# EAGLE design source_eagle (EAGLE 6.4)
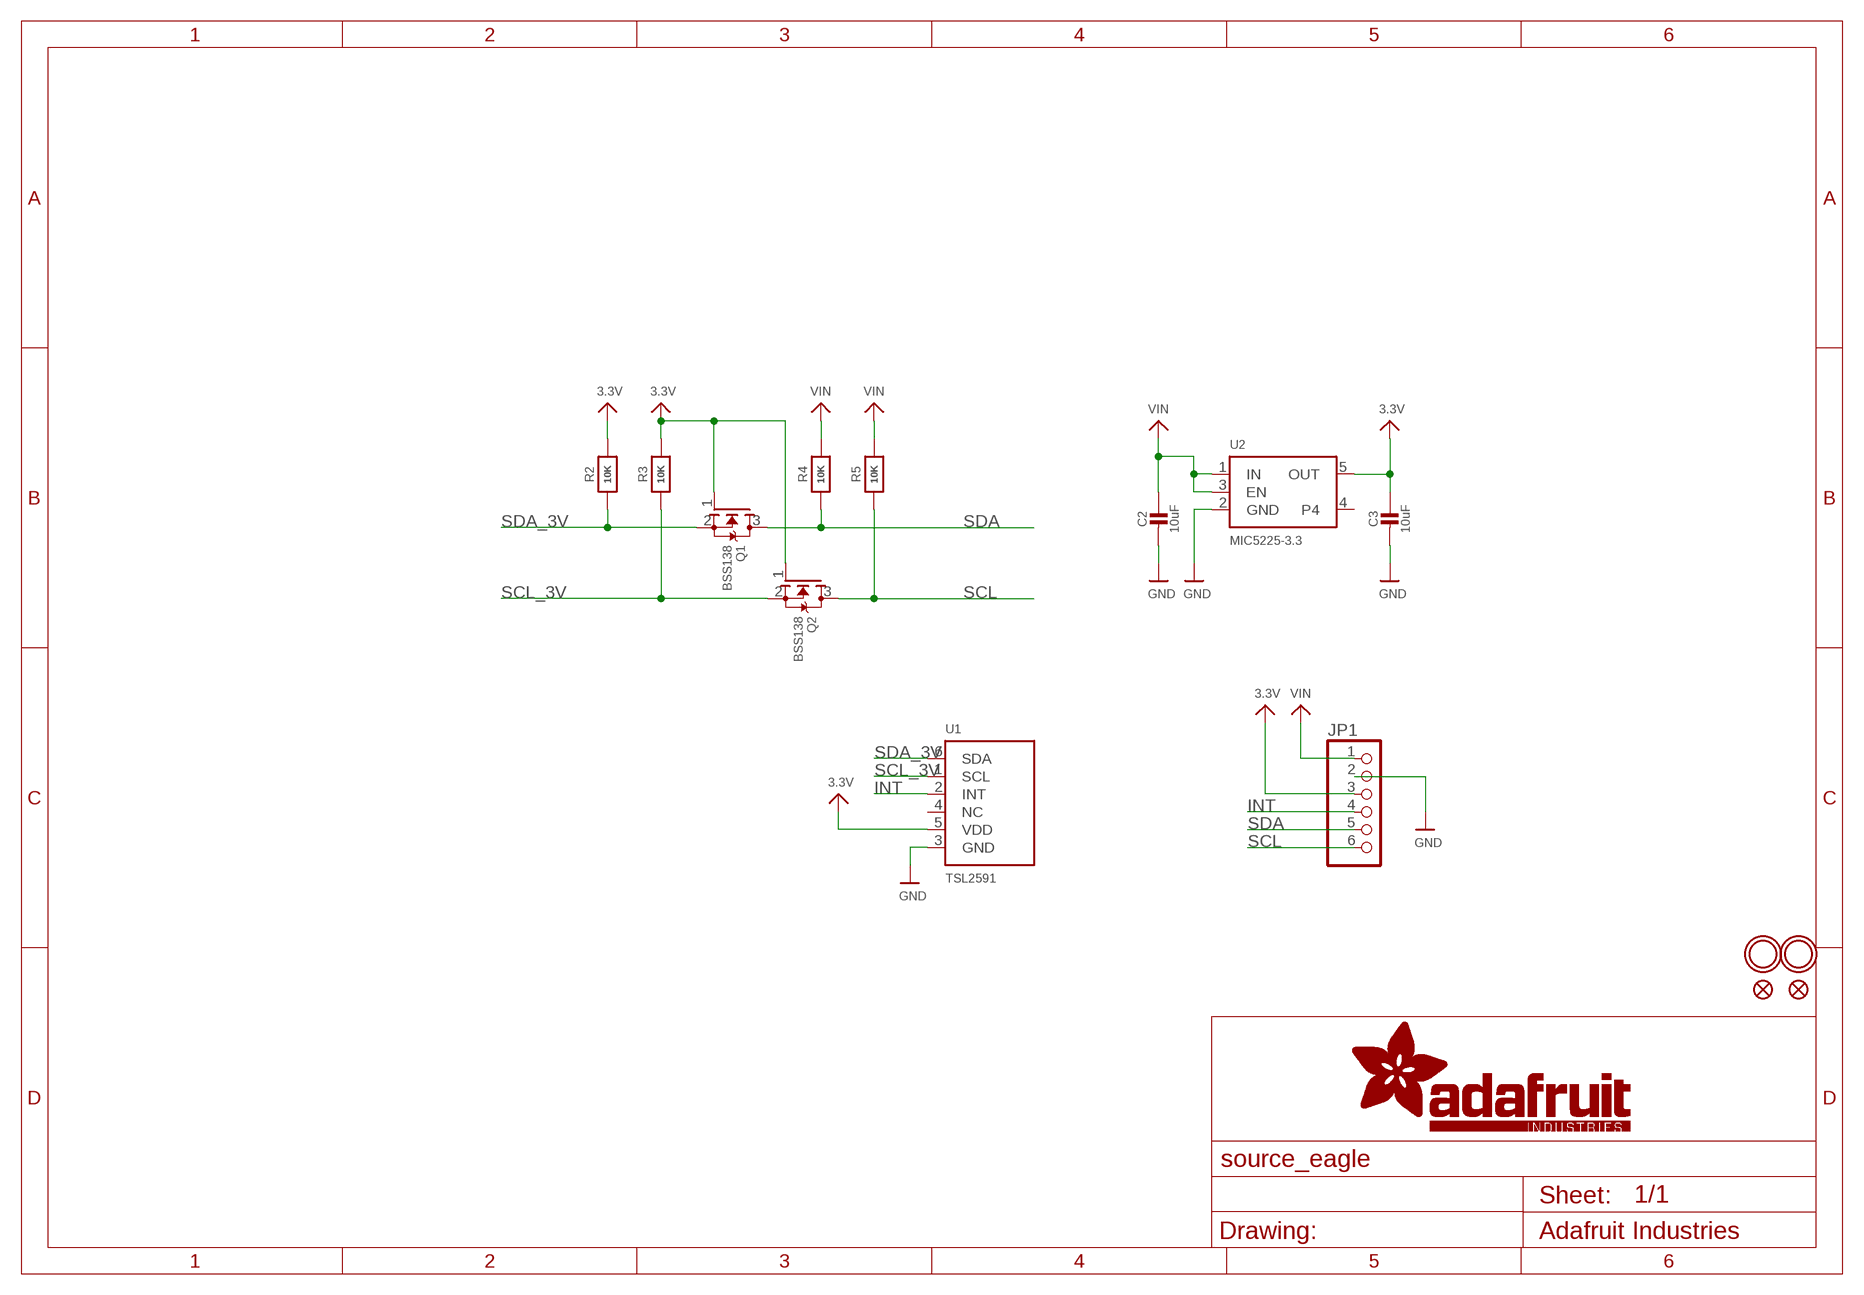
[diagram p0: schematic, sheet 1]

## Parts
C2  10uF  CAP_CERAMIC0805-NOOUTLINE  [0805-NO]
C3  10uF  CAP_CERAMIC0805-NOOUTLINE  [0805-NO]
FID1  FIDUCIAL""  [FIDUCIAL_1MM]
FID2  FIDUCIAL""  [FIDUCIAL_1MM]
JP1  HEADER-1X676MIL_FULLROUND  [1X06_ROUND_FULL_76]
Q1  BSS138  MOSFET-NWIDE  [SOT23-WIDE]
Q2  BSS138  MOSFET-NWIDE  [SOT23-WIDE]
R2  10K  RESISTOR0805_NOOUTLINE  [0805-NO]
R3  10K  RESISTOR0805_NOOUTLINE  [0805-NO]
R4  10K  RESISTOR0805_NOOUTLINE  [0805-NO]
R5  10K  RESISTOR_0805MP  [_0805MP]
U1  TSL2591  LIGHT_TSL2591  [DFN6_TAOS]
U2  MIC5225-3.3  VREG_SOT23-5  [SOT23-5]
U$18  MOUNTINGHOLE2.5  [MOUNTINGHOLE_2.5_PLATED]
U$19  MOUNTINGHOLE2.5  [MOUNTINGHOLE_2.5_PLATED]

## Nets
3.3V: C3.1 JP1.3 Q1.1(G) Q2.1(G) R2.2 R3.2 U1.5(VDD) U2.5(OUT)
GND: C2.2 C3.2 JP1.2 U1.3(GND) U2.2(GND)
INT: JP1.4 U1.2(INT)
SCL: JP1.6 Q2.3(D) R5.1
SCL_3V: Q2.2(S) R3.1 U1.1(SCL)
SDA: JP1.5 Q1.3(D) R4.1
SDA_3V: Q1.2(S) R2.1 U1.6(SDA)
VIN: C2.1 JP1.1 R4.2 R5.2 U2.1(IN) U2.3(EN)
Unconnected: U1.4(NC) U2.4

## Library data of the parts
C2 C3 = microbuilder:CAP_CERAMIC: Ceramic Capacitors For new designs, use the packages preceded by an '_' character since they are more reliable: The following footprints should be used on most boards: _0402 - Standard footprint for regular board layouts _0603 - Standard footprint for regular board layouts _0805 - Standard footprint for regular board layouts _1206 - Standard footprint for regular board layouts For extremely tight-pitch boards where space is at a premium, the following 'micro-pitch' footprints can be used (smaller pads, no silkscreen outline, etc.): _0402MP - Micro-pitch footprint for very dense/compact boards _0603MP - Micro-pitch footprint for very dense/compact boards _0805MP - Micro-pitch footprint for very dense/compact boards _1206MP - Micro-pitch footprint for very dense/compact boards
FID1 FID2 = microbuilder:FIDUCIAL: Fiducial Alignment Points Various fiducial points for machine vision alignment.; BOM: EXCLUDE
JP1 = microbuilder:HEADER-1X6: PIN HEADER
Q1 Q2 = microbuilder:MOSFET-N: N-Channel Mosfet LEGEND VDS: Voltage Drain-Source ID: Drain Current RDS(ON): Drain-Source On-State Resistance VGS(TH): Gate-Source Threshold Voltage CISS: Drain-Source Input Capacitance SOT-23 Name VDS ID RDS(ON) VGS(TH) CISS Order Number 2N7002E 60V 260mA 2.5 Ohm 2.5V @ 250uA 26.7pF @ 25V 2N7002ET1GOSTR-ND BSH103 30V 850mA 400 mOhm 400mV @ 1mA 83pF @ 24V BSH103,235-ND BSS138 60V 320mA 1.6 Ohm 1.5V @ 250uA 50pF @ 10V Mouser: 771-BSS138PW115 DMN2075U-7 20V 4.2A 38 mOhm 1V @ 250 uA 594.3pF @ 10V DMN2075U-7DICT-ND * BSS138 good choice for I2C level-shifting POWERPAK 1212-8 Name VDS ID RDS(ON) VGS(TH) CISS Order Number Si7308DN 60V 6A 58 mOhm 3V @ 250uA 665pF @ 15V SI7308DN-T1-E3CT-ND
R2-R5 = microbuilder:RESISTOR: Resistors For new designs, use the packages preceded by an '_' character since they are more reliable: The following footprints should be used on most boards: _0402 - Standard footprint for regular board layouts _0603 - Standard footprint for regular board layouts _0805 - Standard footprint for regular board layouts _1206 - Standard footprint for regular board layouts For extremely tight-pitch boards where space is at a premium, the following 'micro-pitch' footprints can be used (smaller pads, no silkscreen outline, etc.): _0402MP - Micro-pitch footprint for very dense/compact boards _0603MP - Micro-pitch footprint for very dense/compact boards _0805MP - Micro-pitch footprint for very dense/compact boards _1206MP - Micro-pitch footprint for very dense/compact boards
U1 = microbuilder:LIGHT_TSL2591: TSL2591 Light-To-Digital Sensor
U2 = microbuilder:VREG_SOT23-5: SOT23-5 Fixed Voltage Regulators Part Current Out V Out V In V Dropout θJA (°C/W) TJ (°C) Digikey Part No. ADP121 150mA 3.3V 3.4-5.5V 0.09V @ 150mA -- -- ADP121-AUJZ33R7CT-ND ADP121 150mA 3.0V 3.1-5.5V 0.09V @ 150mA -- -- ADP121-AUJZ30R7CT-ND ADP122 300mA 3.3V 3.4-5.5V 0.085V @ 300mA -- -- ADP122AUJZ-3.3-R7CT-ND ADP1712 300mA 3.3V 3.5-5.5V 0.17V @ 300mA -- -- ADP1712AUJZ-3.3-R7TR-ND AP7311 (Low Cost) 150mA 3.3V 3.5-6V 0.15V @ 150mA -- -- AP7311-33WG-7DICT-ND LD39015M18R 150mA 1.8V 1.9V-5.5V 0.08V @ 100mA -- -- 497-6977-1-ND LP2985A-33DBVR 150mA 3.3V 3.3-16V 0.28V @ 150mA 206 150 296-18479-1-ND MCP1824T-3302E/OT 300mA 3.3V 3.5V-6V 0.2V @ 300mA -- -- MCP1824T-3302E/OTCT-ND MIC5205-2.5YM5 TR 150mA 2.5V 2.7-16V 0.165V @ 150mA -- -- 576-1257-2-ND MIC5205-3.0YM5 TR 150mA 3.0V 3.2V-16V 0.165V @ 150mA -- -- 576-1258-2-ND MIC5205-3.3YM5 TR 150mA 3.3V 3.5V-16V 0.165V @ 150mA -- -- 576-1259-2-ND TPS780330220 150mA 3.3V+2.2V 3.6-5.5V 250mV Max -- -- 296-23332-1-ND TDA3663/N1,135 100mA 3.3V 3.5-45V 0.18V @ 50mA -- -- 568-5343-1-ND Max operating temp can be calculated using θJA, TJ (max junction temperature), and power in watts. Set the "Maximum Ambient Temperature" until it reaches TJ ("Max Junction Temperature"), which is the absolute limit for safe use of the regulator: Heat Sink Temperature Calculator For example, With 12V source into a 3.3V LP2985 and a 30mA load, we are dissipating (12V-3.3V) * 0.03A = 0.261W. With a θJA of 206 °C/W, a TJ of 150°C, and 261mW we can safely use the chip without a heat sink up to 75°C (=147.1°C Junction Temperature).
U$18 U$19 = microbuilder:MOUNTINGHOLE: Mounting Hole For #2 screws (0.086"/2.18mm width, 0.094"/2.4mm hole) use 2.5mm; BOM: EXCLUDE

## Board
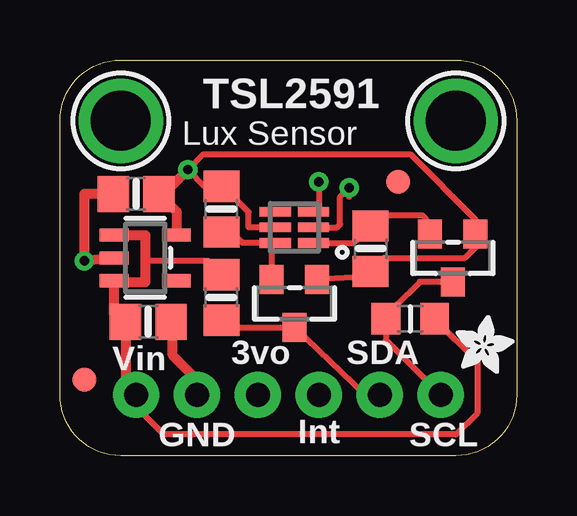
[diagram p1: board, top side]
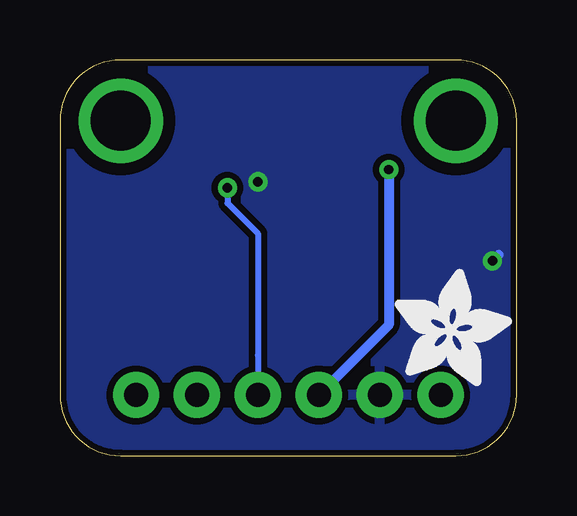
[diagram p2: board, bottom side, seen from below]

Size 19.05 x 16.51 mm. Coordinates in mm from the lower left corner, seen from the top.
Outline: 16.51,0 2.54,0 arc-90 0,2.54 0,13.97 arc-90 2.54,16.51 16.51,16.51 arc-90 19.05,13.97 19.05,2.54 arc-90 16.51,0
Copper layers (1*16): Top 0.035mm / dielectric 1.5mm / Bottom 0.035mm
Design rules "adafruit": minimum track width 8mil, minimum drill 15.5mil, track to track 8mil, track to pad 8mil, pad to pad 8mil, via to via 8mil, smd to smd 8mil, copper to edge 10mil, drill to drill 8mil, minimum pad ring 10mil, minimum via ring 8mil, stop-mask expansion 2mil, vias tented up to drill 20mil, thermal gap 10mil

### Footprints (pad centres in the part's own frame; a part is rotated, then mirrored left to right if it is on the bottom)
0805-NO = smd 1.3 x 1.5: 1 -0.95,0; 2 0.95,0
FIDUCIAL_1MM = smd 1 x 1: 1 0,0
1X06_ROUND_FULL_76 = drill 1 pad 1.93: 1 -6.35,0; 2 -3.81,0; 3 -1.27,0; 4 1.27,0; 5 3.81,0; 6 6.35,0
SOT23-WIDE = smd 1 x 1.2: 1 -0.95,-1; 2 0.95,-1; 3 0,1
_0805MP = smd 1.2 x 1.3: 1 -1.016,0; 2 1.016,0
DFN6_TAOS = smd 1.3 x 0.4: 1 -0.8,0.65; 2 -0.8,0; 3 -0.8,-0.65; 4 0.8,-0.65; 5 0.8,0; 6 0.8,0.65
SOT23-5 = smd 0.55 x 1.2: 1 -0.95,-1.3; 2 0,-1.3; 3 0.95,-1.3; 4 0.95,1.3; 5 -0.95,1.3
MOUNTINGHOLE_2.5_PLATED = drill 2.5 pad 3.2: P$1 0,0

### Placement (x,y rotation side)
C2  3.68,5.59 0 top
C3  3.17,10.92 180 top
FID1  14.1,11.43 0 top
FID2  1.02,3.17 0 top
JP1  9.53,2.54 0 top
Q1  9.78,6.35 180 top
Q2  16.38,8.26 180 top
R2  6.73,10.29 90 top
R3  12.95,8.64 270 top
R4  6.73,6.6 90 top
R5  14.61,5.71 0 top
U1  9.78,9.53 180 top
U2  3.56,8.26 270 top
U$15  [ADAFRUIT_2.5MM]  16.51,3.43 0 top
U$18  2.54,13.97 0 top
U$19  16.51,13.97 0 top
U$20  [ADAFRUIT_5MM]  5.08,2.92 0 bottom

### Tracks (layer width: path | path; a pad name or v marks a point on that pad's centre or on a via)
3.3V  (via drill 0.39)
  Top 0.254: U1.5 7.87,9.53 7.87,10.16 6.8,11.24 R2.2 6.04,11.24 v5.33,11.94 5.97,12.57 14.61,12.57 17.33,9.85 Q2.1 17.33,8.7 16.89,8.26 13.52,8.26 R3.2 13,7.48 Q1.1 10.81,7.55
  Top 0.406: U2.5 4.86,10.19 C3.1 4.32,10.92 v5.33,11.94
  Bottom 0.406: v5.33,11.94 5.33,5.46 JP1.3
GND  (via drill 0.39)
  Top 0.254: v10.79,11.43 10.79,10.39 U1.3
  Top 0.406: U2.2 v1.02,8.13 1.02,10.92 C3.2 | JP1.2 5.71,3.17 4.7,4.19 4.7,5.27 C2.2
  Bottom 0.254: v10.79,11.43 10.67,11.43
  Bottom 0.406: v1.02,8.13 0.76,8.38
  pour Bottom (isolate 0.254): 0,16.51 20.32,16.51 20.32,-0.13 0,-0.13
INT  (via drill 0.39)
  Top 0.254: 12.06,10.79 v12.06,11.18 11.68,10.79 11.68,9.65 11.56,9.53 U1.2
  Bottom 0.254: 10.79,4.19 JP1.4 10.79,9.27 12.06,10.54 v12.06,11.18
SCL
  Top 0.254: Q2.3 15,7.25 13.97,6.22 13.97,6.1 R5.1 13.59,4.83 JP1.6
SCL_3V
  Top 0.254: Q2.2 15.43,9.71 15.11,10.03 13.65,10.03 R3.1 12.24,8.88 U1.1
SDA
  Top 0.254: JP1.5 12.72,2.54 Q1.3 7.04,5.35 R4.1
SDA_3V
  Top 0.254: R2.1 6.9,9.51 7.62,8.89 8.96,8.89 U1.6 8.83,8.77 Q1.2
VIN
  Top 0.254: JP1.1 3.17,2.03 4.32,0.89 16.51,0.89 17.4,1.78 17.4,3.94 R5.2 | R4.2 6.16,8.13 3.56,8.13
  Top 0.406: JP1.1 2.73,2.98 C2.1 2.26,5.94 U2.3 2.26,7.24 3.56,7.24 3.56,8.13 3.56,9.21 U2.1

### Text on the board
tPlace: TSL2591 | Lux Sensor | Vin | 3vo | SDA | GND | Int | SCL